# EasyEDA Pro project P3+KG.epro, board PCB10
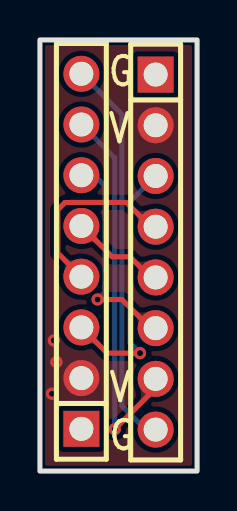
[diagram p15: board, top side]
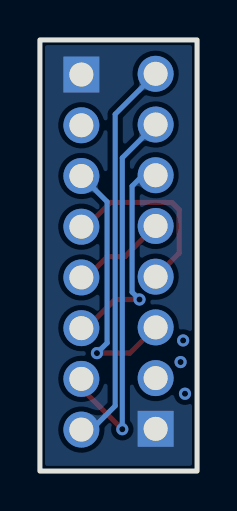
[diagram p16: board, bottom side, seen from below]

Outline 7.87 x 21.59 mm; copper layers: Top Layer, Bottom Layer. Coordinates in mm from the lower left corner of the outline.
Outline path: rectangle 0,0 7.87,21.59
Stack: Top Layer 0.035mm / Dielectric1 1.51mm FR4 er 4.5 / Bottom Layer 0.035mm

## Design rules (mm)
template: 自定义配置
spacing copperThickness1oz (default): track to track 0.102, other pairs 0.152 to 0.3
spacing copperThickness2oz: track to track 0.203, other pairs 0.152 to 0.3
track width copperThickness1oz (default): min 0.127, default 0.254, max 2.54
track width copperThickness2oz: min 0.203, default 0.254, max 2.54
differential pair differentialPair (default): width min 0.127, default 0.254, max 2.54; gap min 0.152, default 0.152
via viaSize (default): diameter min 0.5, default 0.61, max 10; hole min 0.3, default 0.305, max 6.3

## Placement (name value [footprint] x y rotation side)
U20  -  [HDR-TH_8P-P2.54-V-F-1]  3.75 9.33 90 top
U21  -  [HDR-TH_8P-P2.54-V-F-1]  4.13 12.64 270 top

## Footprints (pads in the part's own frame, mm; a bottom-side part is the same pattern mirrored in y, then rotated)
HDR-TH_8P-P2.54-V-F-1
  rect 1.8x1.8 hole 1.2: 1(-7.22,1.67)
  round 1.8 hole 1.2: 2(-4.68,1.67) 3(-2.14,1.67) 4(0.4,1.67) 5(2.94,1.67) 6(5.48,1.67) 7(8.02,1.67) 8(10.56,1.67)

## Nets
As in the schematic.

## Via types
v1: diameter 0.61, hole 0.305, Top Layer to Bottom Layer, 6 vias

## Routing (per net, layer and track width the routed paths; a pad name or vN(x,y) marks a point on that pad's centre or on a via; arc(x,y) is an arc through that point)
VCCTFT:
  vias: v1(0.6,3.87) v1(0.7,6.54) v1(0.83,5.46)
K14: length 19.4
  Bottom Layer w0.254: U20.8 4.1,17.87 4.1,3.26 5.29,2.08 5.54,2.08
K15-SCK: length 13.1
  Top Layer w0.254: U20.3 3.37,5.91 v1(5.02,5.91)
  Bottom Layer w0.254: v1(5.02,5.91) 4.51,6.41 4.51,13.49 5.8,14.78
L7: length 19.2
  Top Layer w0.254: 5.54,4.62 5.54,3.89 v1(3.75,2.1)
  Bottom Layer w0.254: U20.7 3.75,15.68 v1(3.75,2.1)
M8: length 10.5
  Top Layer w0.254: v1(2.89,8.59) 4.11,8.59 5.54,7.16
  Bottom Layer w0.254: U20.6 2.71,14.81 3.26,14.27 3.26,8.96 v1(2.89,8.59)
M9-RST: length 4.5
  Top Layer w0.254: U20.5 3.62,10.73 4.51,10.73 5.54,9.7
M10-MOSI: length 9.1
  Top Layer w0.254: U20.4 0.9,10.91 0.9,13.09 1.26,13.45 1.59,13.45 1.59,13.45 4.33,13.45 5.54,12.24

## Copper pours and planes (outline as drawn; the poured copper is in the pictures)
GND on Bottom Layer: -1.59,23.56 9.72,23.56 9.72,-0.7 -1.59,-0.7
VCCTFT on Top Layer: -2.22,23.05 9.84,23.05 9.84,-3.24 -2.22,-3.24

Small or netless copper shapes (teardrops, artwork), in the pictures only: 10 on Top Layer, 8 on Bottom Layer

## Text on the board
Top Silkscreen Layer: G | V
